# Altium schematic sheet DC Motor Control_2.SchDoc
size A4; SheetNumber: 6; SheetTotal: 7
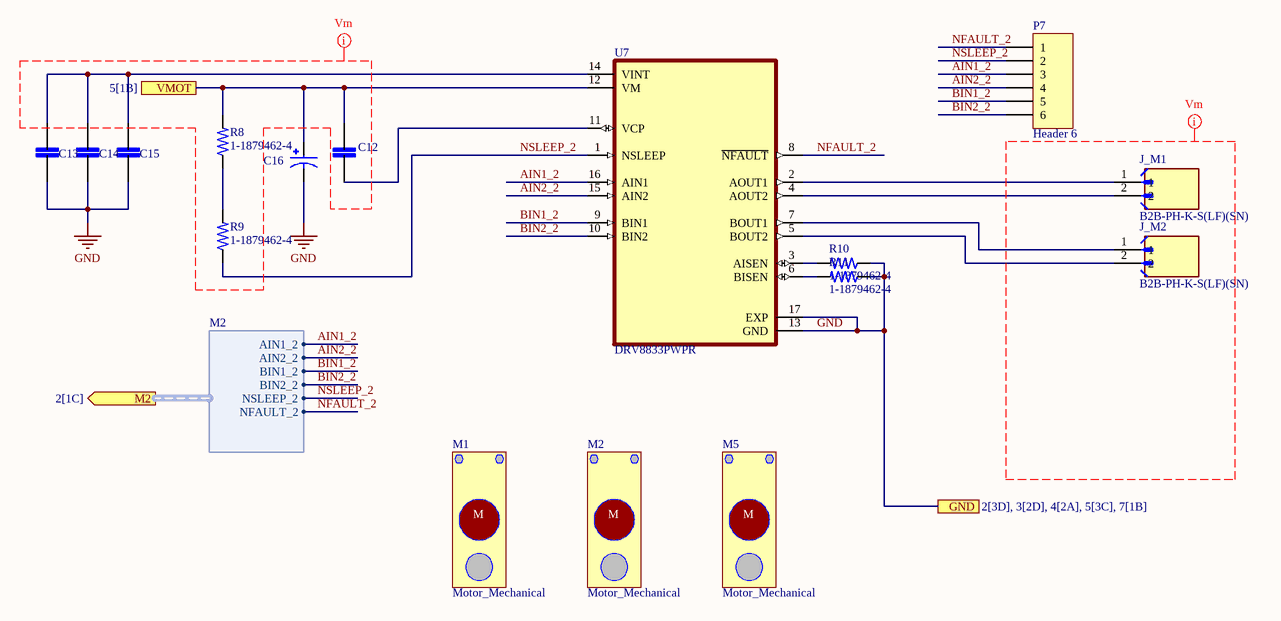
[diagram p0: DC Motor Control_2.SchDoc]

## Parts
C12  LD051A121KAB2A  [CAPC2012X140N]  (value not drawn)
C13  LD051A121KAB2A  [CAPC2012X140N]  (value not drawn)
C14  LD051A121KAB2A  [CAPC2012X140N]  (value not drawn)
C15  LD051A121KAB2A  [CAPC2012X140N]  (value not drawn)
C16  EEEHA1V101UP  [CAP_EEEHA1V101UP]  (value not drawn)
J_M1  B2B-PH-K-S(LF)(SN)  [JST_B2B-PH-K-S(LF)(SN)]
J_M2  B2B-PH-K-S(LF)(SN)  [JST_B2B-PH-K-S(LF)(SN)]
M1  Motor_Mechanical  [Motor_mechanical]
M2  Motor_Mechanical  [Motor_mechanical]
M5  Motor_Mechanical  [Motor_mechanical]
P7  Header 6  [HDR1X6]
R8  1-1879462-4  [RESC3115X65N]
R9  1-1879462-4  [RESC3115X65N]
R10  1-1879462-4  [RESC3115X65N]
R11  1-1879462-4  [RESC3115X65N]
U7  DRV8833PWPR  [IC_DRV8833PWPR]

## Ports
GND (see 2[3D], 3[2D], 4[2A], 5[3C], 7[1B]), M2 (out, harness M2, see 2[1C]), VMOT (see 5[1B])

## Harnesses
M2: AIN1_2, AIN2_2, BIN1_2, BIN2_2, NSLEEP_2, NFAULT_2

## Nets
GND: C13.2 C14.2 C15.2 C16.2 R10.1 R11.1 U7.13(GND) U7.17(EXP) ; port GND
AIN1_2: P7.3 U7.16(AIN1) ; port M2.AIN1_2
AIN2_2: P7.4 U7.15(AIN2) ; port M2.AIN2_2
BIN1_2: P7.5 U7.9(BIN1) ; port M2.BIN1_2
BIN2_2: P7.6 U7.10(BIN2) ; port M2.BIN2_2
NFAULT_2: P7.1 U7.8(~{NFAULT}) ; port M2.NFAULT_2
NSLEEP_2: P7.2 R9.1 U7.1(NSLEEP) ; port M2.NSLEEP_2
VMOT: C12.1 C16.1 R8.2 U7.12(VM) ; port VMOT
NetC12_2: C12.2 U7.11(VCP)
NetC13_1: C13.1 C14.1 C15.1 U7.14(VINT)
NetJ_M1_1: J_M1.1 U7.2(AOUT1)
NetJ_M1_2: J_M1.2 U7.4(AOUT2)
NetJ_M2_1: J_M2.1 U7.7(BOUT1)
NetJ_M2_2: J_M2.2 U7.5(BOUT2)
NetR8_1: R8.1 R9.2
NetR10_2: R10.2 U7.3(AISEN)
NetR11_2: R11.2 U7.6(BISEN)

## Layout directives
net class Vm; rule Width Constraint [Pref Width = 0.5mm    Min Width = 0.354mm    Max Width = 1mm]: (no net found under the mark)

## Notes on the sheet
- (in symbol Motor_Mechanical) M

## Library data of the parts
C12-C15 = LD051A121KAB2A: 120PF 100V 10% 0805; MF: {'manufacturer': u'AVX'}; Package: None; Price: None; Value: *; MP: LD051A121KAB2A; Availability: Unavailable
C16 = EEEHA1V101UP: MF: {'manufacturer': u'Panasonic'}; Value: *; MP: EEEHA1V101UP; Availability: Unavailable; Package: None; Price: None
J_M1 J_M2 = B2B-PH-K-S(LF)(SN): Connector Header Through Hole 2 position 0.079 (2.00mm); MF: JST; SnapEDA_Link: https://www.snapeda.com/parts/B2B-PH-K-S%20(LF)(SN)/JST/view-part/?ref=snap; Package: None; Value: *; MP: B2B-PH-K-S (LF)(SN); Check_prices: https://www.snapeda.com/parts/B2B-PH-K-S%20(LF)(SN)/JST/view-part/?ref=eda
P7 = Header 6: Header, 6-Pin; LatestRevisionDate: 17-Jul-2002; LatestRevisionNote: Re-released for DXP Platform.; Publisher: Altium Limited
R8-R11 = 1-1879462-4: RL73H 2B R43 1% 5K RL; MF: {'manufacturer': u'TE Connectivity'}; Package: None; Price: None; Value: *; MP: 1-1879462-4; Availability: Unavailable
U7 = DRV8833PWPR: 10.8-V, 2-A dual H-bridge motor driver with current regulation 16-HTSSOP -40 to 85; MF: {'manufacturer': u'Texas Instruments'}; Package: None; Price: None; MP: DRV8833PWPR; Availability: Unavailable; Value: *